# Altium schematic sheet push-button-switch-3.SchDoc
size A4; SheetNumber: 3; SheetTotal: 17
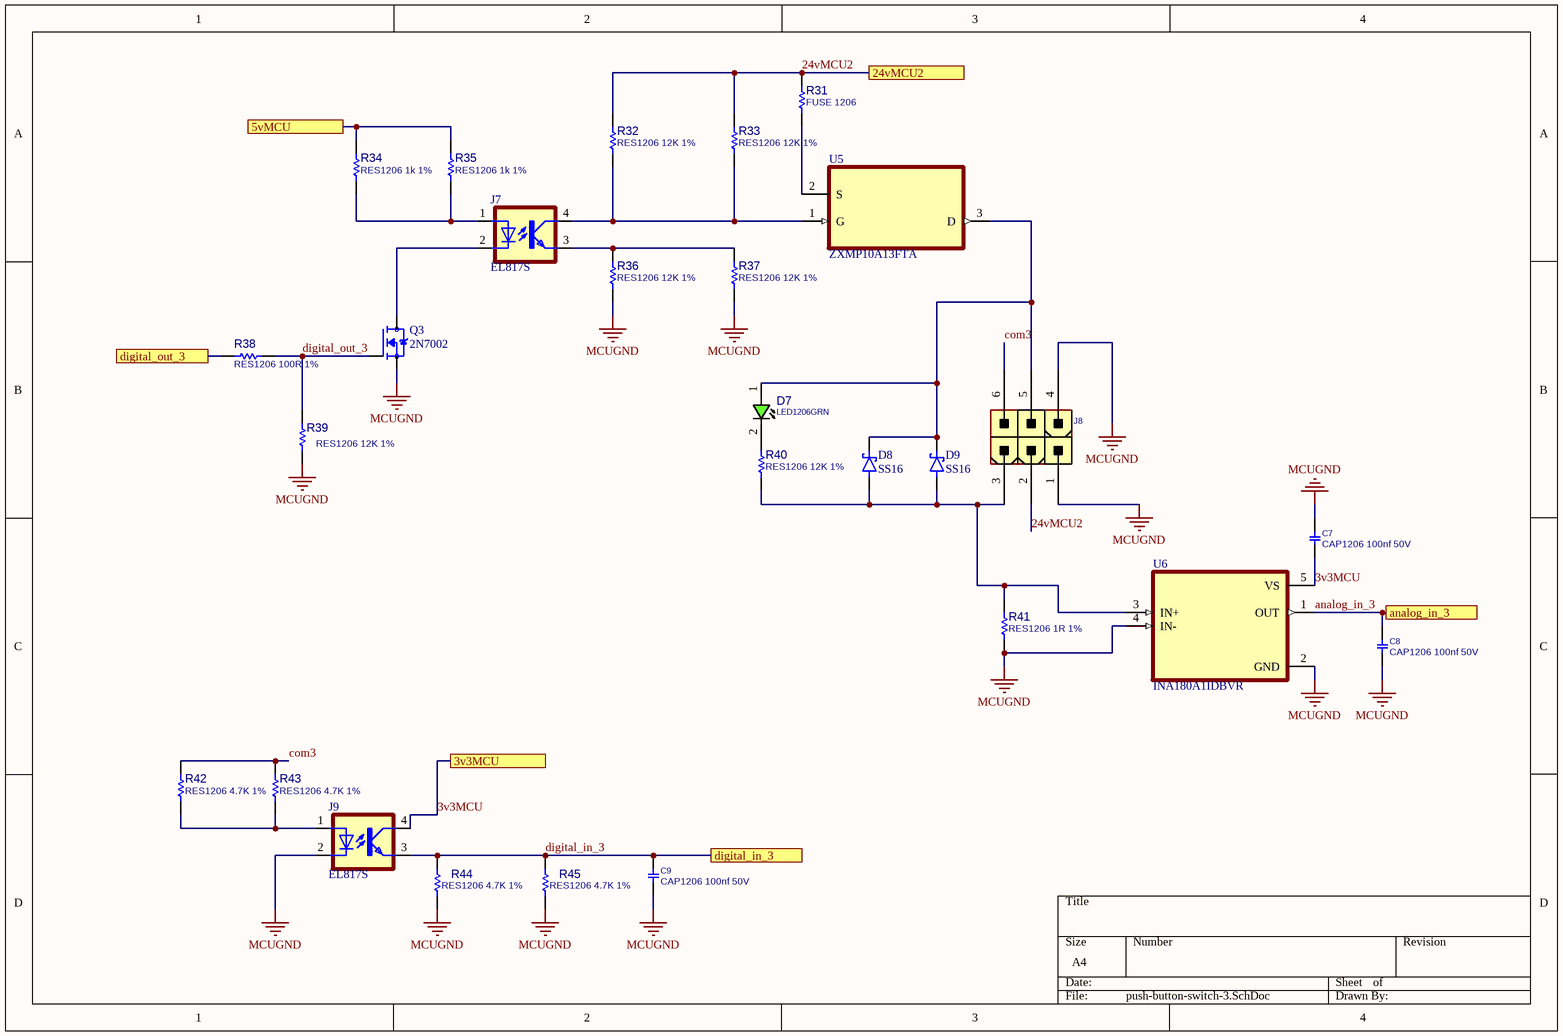
[diagram p0: push-button-switch-3.SchDoc]

## Parts
C7  CAP1206 100nf 50V  [C1206]
C8  CAP1206 100nf 50V  [C1206]
C9  CAP1206 100nf 50V  [C1206]
D7  LED1206GRN  [LED1206GRN]
D8  SS16  [DIOM4325X250N]
D9  SS16  [DIOM4325X250N]
J7  EL817S  [SOIC254P1030X460-4N]
J8  CONN_ATXPWR_6  [ATXPWR_6]  (value not drawn)
J9  EL817S  [SOIC254P1030X460-4N]
Q3  2N7002  [SOT95P240X111-3N]
R31  FUSE 1206  [R1206]
R32  RES1206 12K 1%  [R1206]
R33  RES1206 12K 1%  [R1206]
R34  RES1206 1k 1%  [R1206]
R35  RES1206 1k 1%  [R1206]
R36  RES1206 12K 1%  [R1206]
R37  RES1206 12K 1%  [R1206]
R38  RES1206 100R 1%  [R1206]
R39  RES1206 12K 1%  [R1206]
R40  RES1206 12K 1%  [R1206]
R41  RES1206 1R 1%  [R1206]
R42  RES1206 4.7K 1%  [R1206]
R43  RES1206 4.7K 1%  [R1206]
R44  RES1206 4.7K 1%  [R1206]
R45  RES1206 4.7K 1%  [R1206]
U5  ZXMP10A13FTA  [SOT95P230X110-3N]
U6  INA180A1IDBVR  [SOT95P280X145-5N]

## Ports
3v3MCU, 5vMCU, 24vMCU2, analog_in_3, digital_in_3, digital_out_3

## Nets
MCUGND: C7.1 C8.2 C9.2 J8.1 J8.4 J9.2(C) Q3.2(S) R36.2 R37.2 R39.2 R41.2 R44.1 R45.1 U6.2(GND) U6.4(IN-)
3v3MCU: C7.2 J9.4(COL) U6.5(VS) ; port 3v3MCU
5vMCU: R34.2 R35.2 ; port 5vMCU
24vMCU2: J8.2 R31.1 R32.1 R33.1 ; port 24vMCU2
analog_in_3: C8.1 U6.1(OUT) ; port analog_in_3
com3: J8.6 R42.2 R43.2
digital_in_3: C9.1 J9.3(EMIT) R44.2 R45.2 ; port digital_in_3
digital_out_3: Q3.1(G) R38.2 R39.1
digital_out_3: R38.1 ; port digital_out_3  [a separate net that carries the same name]
NetD7_1: D7.1(ANODE) D8.C(K) D9.C(K) J8.5 U5.3(D)
NetD7_2: D7.2(CATHODE) R40.1
NetD8_A: D8.A D9.A J8.3 R40.2 R41.1 U6.3(IN+)
NetJ7_1: J7.1(A) R34.1 R35.1
NetJ7_2: J7.2(C) Q3.3(D)
NetJ7_3: J7.3(EMIT) R36.1 R37.1
NetJ7_4: J7.4(COL) R32.2 R33.2 U5.1(G)
NetJ9_1: J9.1(A) R42.1 R43.1
NetR31_2: R31.2 U5.2(S)

## Library data of the parts
C7-C9 = CAP_SMD_MLCC_1206: CAP, MLCC; PARAM: -, -%; MANF_P#: MANF_PART#; PARAM2: -V; PRICE: 100= 1$; MANF: -; ASSEMBLY: ASSEMBLY
D7 = LED_SMD_1206_GRN: LED, SMD, 1206, GREEN; PARAM: 20mA; DESC: DESCRIPTION; PARAM2: 2.2V; MANF: -; ASSEMBLY: ASSEMBLY; PRICE: 36t@Javan; MANF_P#: -; VALUE: LED1206GRN; MountType: SMT; PartType: LED
D8 D9 = SS14: 1A, 40V, Schottky Rectifier; MF: Taiwan Semiconductor; SnapEDA_Link: https://www.snapeda.com/parts/SS14/taiwan/view-part/?ref=snap; Package: SMA-2 Taiwan Semiconductor; Value: *; MP: SS14; Check_prices: https://www.snapeda.com/parts/SS14/taiwan/view-part/?ref=eda
J7 J9 = EL817S: Optoisolator Transistor Output 5000Vrms 1 Channel 4-SMD; MF: Everlight Electronics; SnapEDA_Link: https://www.snapeda.com/parts/EL817S/Everlight+Electronics+Co+Ltd/view-part/?ref=snap; Package: SMD-4 Everlight Electronics Co Ltd; Value: *; MP: EL817S; Check_prices: https://www.snapeda.com/parts/EL817S/Everlight+Electronics+Co+Ltd/view-part/?ref=eda
J8 = CONN_ATXPWR_6: CONN, ATX POWER, 6 P; MANF: TE; MANF_P#: 4-1775099-1; VALUE: CONN_ATXPWR_6; MountType: THD; PACKAGE: ATXPWR-6pin; Part Type: Conn.
Q3 = 2N7002: N-Channel 60V 280mA (Ta) 350mW (Ta) Surface Mount SOT-23-3 (TO-236); MF: {'manufacturer': u'onsemi'}; Package: None; Price: None; Value: *; MP: 2N7002; Availability: Unavailable
R31-R45 = RES_SMD_1206: RESISTOR, SMD; PARAM: 1%, 0.25W; DESC: DESCRIPTION; DIST#: MOUSER; MANF_P#: -; MANF: -; ASSEMBLY: ASSEMBLY; PRICE: -; PARAM2: -
U5 = ZXMP10A13FTA: P-Channel 100 V 600mA (Ta) 625mW (Ta) Surface Mount SOT-23-3; MF: Diodes Inc.; Purchase-URL: https://pricing.snapeda.com/search/part/ZXMP10A13FTA/?ref=eda; Package: SOT-23-3 Diodes Inc.; SnapEDA_Link: https://www.snapeda.com/parts/ZXMP10A13FTA/Diodes+Inc./view-part/?ref=snap; Availability: In Stock; Value: *; MP: ZXMP10A13FTA; Check_prices: https://www.snapeda.com/parts/ZXMP10A13FTA/Diodes+Inc./view-part/?ref=eda; Price: None
U6 = INA180A1IDBVR: 26V, 350kHz current sense amplifier; MF: Texas Instruments; SnapEDA_Link: https://www.snapeda.com/parts/INA180A1IDBVR/Texas+Instruments/view-part/?ref=snap; Package: SOT-23-5 Texas Instruments; Value: *; MP: INA180A1IDBVR; Check_prices: https://www.snapeda.com/parts/INA180A1IDBVR/Texas+Instruments/view-part/?ref=eda